# Altium schematic sheet 01M21V00-Sensor-Sheet.SchDoc
size A4; SheetNumber: 8; SheetTotal: 11
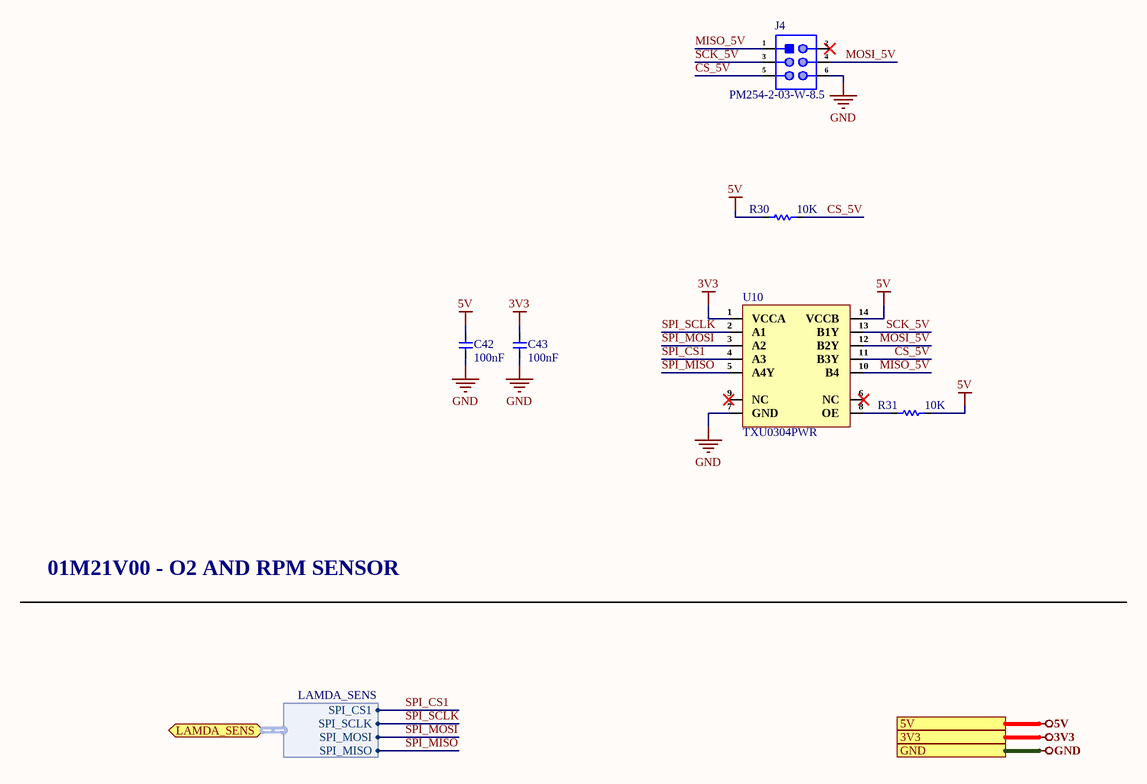
[diagram p0: 01M21V00-Sensor-Sheet.SchDoc]

## Parts
C42  100nF  [Cap-0603]
C43  100nF  [Cap-0603]
J4  PM254-2-03-W-8.5  [HDR 2x3 right angle Female (2.54mm)]
R30  10K  [Res-0603]
R31  10K  [Res-0603]
U10  TXU0304PWR  [14-TSSOP]

## Ports
3V3 (see Top-Sheet[4A], 0-24mA-Input-Sheet[3D], 20x4-Display-Sheet[3D], Connectors-SW-LEDs-Sheet[3D], Controller-Sheet[3D], Optical-Encoder-Sheet[3D], Power-Sheet[3D], Stepper-Driver-Sheet[3D]), 5V (see Top-Sheet[4A], 20x4-Display-Sheet[3D], Connectors-SW-LEDs-Sheet[3D], Optical-Encoder-Sheet[3D], Power-Sheet[3D]), GND (see Top-Sheet[4A], 0-24mA-Input-Sheet[3D], 20x4-Display-Sheet[3D], Buzzer-Sheet[3D], Connectors-SW-LEDs-Sheet[3D], Controller-Sheet[3D], Optical-Encoder-Sheet[3D], Power-Sheet[3D], Relay-Sheet[3D], Stepper-Driver-Sheet[3D]), LAMDA_SENS (bidir, harness LAMDA_SENS, see Top-Sheet[3A], Controller-Sheet[1D])

## Harnesses
LAMDA_SENS: SPI_CS1, SPI_SCLK, SPI_MOSI, SPI_MISO

## Nets
3V3: C43.1 U10.1(VCCA) ; port 3V3
5V: C42.1 R30.2 R31.1 U10.14(VCCB) ; port 5V
GND: C42.2 C43.2 J4.6 U10.7(GND) ; port GND
CS_5V: J4.5 R30.1 U10.11(B3Y)
MISO_5V: J4.1 U10.10(B4)
MOSI_5V: J4.4 U10.12(B2Y)
SCK_5V: J4.3 U10.13(B1Y)
SPI_CS1: U10.4(A3) ; port LAMDA_SENS.SPI_CS1
SPI_MISO: U10.5(A4Y) ; port LAMDA_SENS.SPI_MISO
SPI_MOSI: U10.3(A2) ; port LAMDA_SENS.SPI_MOSI
SPI_SCLK: U10.2(A1) ; port LAMDA_SENS.SPI_SCLK
NetR31_2: R31.2 U10.8(OE)

Not connected (* = marked no-connect by the designer): J4 2*; U10 6(NC)* 9(NC)*

## Notes on the sheet
- 01M21V00 - O2 AND RPM SENSOR
- File:
- Title:
- Date:
- Page
- Num:
- Total:
- Drawn By: Huzaifa Ali

## Library data of the parts
C42 C43 = CC0603KRX5R9BB104: CAP CER 0.1UF 50V X5R 0603; Manufacturer: Yageo; Tolerance: 10%; Item Type: Capacitor; Supplier 1: Digi-Key; Manufacturer Part Number: CC0603KRX5R9BB104; RoHS: Yes; Category: Ceramic Capacitors; Stock 1: 152253; Pricing 1: 1=0.10000, 10=0.05200, 50=0.02820, 100=0.02310, 500=0.01648, 1000=0.01294 (USD); Mount: Surface Mount; Case/Package: 0603; Case Code (Imperial): 0603; Case Code (Metric): 1608; Weight: 7.1E-05oz; Min Operating Temperature: -55°C; Max Operating Temperature: 85°C; Capacitance: 100nF; Packaging: Tape and Reel; Voltage Rating: 50V; Dielectric: X5R; Termination: SMD/SMT; Voltage Rating (DC): 50V; Package Quantity: 4000; Length: 0.063inch; Width: 0.031inch; Thickness: 0.035inch; Lead Free: Lead Free; Halogen Free: Halogen Free; ComponentLink1URL: http://www.mouser.com/ds/2/447/Yageo_UPY-GP_NP0_16V-to-50V_9-358835.pdf?src-supplier=Mouser; ComponentLink1Description: http://www.mouser.com/ds/2/447/Yageo_UPY-GP_NP0_16V-to-50V_9-358835.pdf?src-supplier=Mouser; ComponentLink2URL: https://www.yageo.com/upload/media/product/productsearch/datasheet/mlcc/UPY-GPHC_X5R_4V-to-50V_26.pdf?src-supplier=Digi-Key; ComponentLink2Description: https://www.yageo.com/upload/media/product/productsearch/datasheet/mlcc/UPY-GPHC_X5R_4V-to-50V_26.pdf?src-supplier=Digi-Key; ComponentLink3URL: http://www.yageo.com/exep/pages/download/literatures/ProductSelectionGuide%202014_Final_2.pdf?src-supplier=Digi-Key; ComponentLink3Description: http://www.yageo.com/exep/pages/download/literatures/ProductSelectionGuide%202014_Final_2.pdf?src-supplier=Digi-Key; Supplier Part Number 1: 311-4046-1-ND; LCSC Part Number: C110022
J4 = PM254-2-03-W-8.5: 2.54mm 2.54mm 双排 3A Copper Alloy 6P -40℃~+105℃ 260℃@5S Right-Angle 2x3P side 8.5mm Square Holes Push-Pull,P=2.54mm Female Headers ROHS; Manufacturer: HCTL; Manufacturer Part Number: PM254-2-03-W-8.5; Package: Push-Pull,P=2.54mm; LCSC Part Number: C2897423; Item Type: Female Header; ComponentLink1Description: LCSC; ComponentLink1URL: https://www.lcsc.com/product-detail/Female-Headers_HCTL-PM254-2-03-W-8-5_C2897423.html
R30 R31 = RC0603FR-0710KL: RES SMD 10K Ohm 1% 1/10W 0603; Manufacturer: Yageo; Resistance: 10kR; Temperature Coefficient: 100ppm/°C; Voltage Rating (DC): 50V; Power Rating: 100mW; Voltage Rating: 75V; Item Type: Resistor; Supplier 1: Digi-Key; Manufacturer Part Number: RC0603FR-0710KL; RoHS: Yes; Category: Chip SMD Resistors; Stock 1: 25249139; Pricing 1: 1=0.10000, 10=0.02400, 100=0.00970, 1000=0.00436, 2500=0.00378 (USD); Case/Package: 0603; Number of Pins: 2; Case Code (Imperial): 0603; Case Code (Metric): 1608; Weight: 7.1E-05oz; Size Code: 0603; Min Operating Temperature: -55°C; Max Operating Temperature: 155°C; Tolerance: 1%; Resistor Type: Thick Film; Packaging: Tape and Reel; Termination: SMD/SMT; Features: Moisture Resistant; Series: RC; Max Power Dissipation: 100mW; Number of Terminations: 2; Resistance Tolerance: 1%; Construction: Rectangular; Length: 1.6mm; Width: 0.8mm; Height: 0.45mm; Depth: 0.8mm; Lead Pitch: 0.3mm; REACH SVHC: Unknown; Lead Free: Lead Free; Military Standard: Not; RoHS Compliant: Yes; ComponentLink1URL: https://datasheet.ciiva.com/7660/38590-7660789.pdf?src-supplier=Element14; ComponentLink1Description: https://datasheet.ciiva.com/7660/38590-7660789.pdf?src-supplier=Element14; ComponentLink2URL: https://datasheet.ciiva.com/7983/443971-7983596.pdf?src-supplier=Element14; ComponentLink2Description: https://datasheet.ciiva.com/7983/443971-7983596.pdf?src-supplier=Element14; ComponentLink3URL: https://datasheet.ciiva.com/22747/443971-22747519.pdf?src-supplier=Element14; ComponentLink3Description: https://datasheet.ciiva.com/22747/443971-22747519.pdf?src-supplier=Element14; ComponentLink4URL: https://datasheet.ciiva.com/46440/1868787-46440891.pdf?src-supplier=Element14; ComponentLink4Description: https://datasheet.ciiva.com/46440/1868787-46440891.pdf?src-supplier=Element14; ComponentLink5URL: https://datasheet.ciiva.com/7746/1738695-7746239.pdf?src-supplier=Element14; ComponentLink5Description: https://datasheet.ciiva.com/7746/1738695-7746239.pdf?src-supplier=Element14; ComponentLink6URL: https://datasheet.ciiva.com/15189/getdatasheetpartid-409289-15189591.pdf?src-supplier=Verical; ComponentLink6Description: https://datasheet.ciiva.com/15189/getdatasheetpartid-409289-15189591.pdf?src-supplier=Verical; Supplier Part Number 1: 311-10.0KHRCT-ND; LCSC Part Number: C98220
U10 = TXU0304PWR: IC TRANSLATOR UNIDIR 14TSSOP; Manufacturer: Texas Instruments; Number of Bits: 4NUMBER; Supplier: Mouser; LCSC Part Number: C4364118; Manufacturer Part Number: TXU0304PWR; RoHS: No; Item Type: IC; Stock: 25859; Pricing: 1=0.85, 10=0.745, 50=0.745, 100=0.581, 1000=0.387, 10000=0.33 (USD); Case/Package: 71Case; Pins: 14NUMBER; Length: 5mm; Width: 4.4mm; Height: 1.2mm; Thickness: 1mm